# Altium schematic sheet Connector-Sheet.SchDoc
size A4; DocumentNumber: 5; SheetNumber: 5; SheetTotal: 5
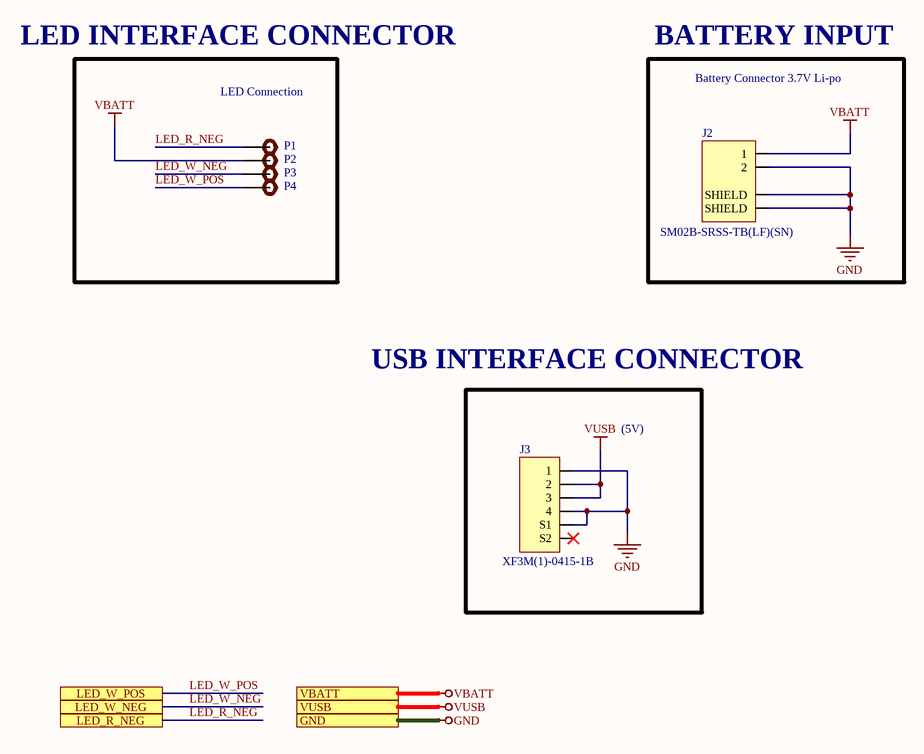
[diagram p0: Connector-Sheet.SchDoc]

## Parts
J2  SM02B-SRSS-TB(LF)(SN)  [SM02B-SRSS-TB(LF)(SN)]
J3  XF3M(1)-0415-1B  [XF3M(1)-0415-1B]
P1  TEST POINT 0.5mm Dia  [Test-point - 0.5mm]  (value not drawn)  (no BOM)
P2  TEST POINT 0.5mm Dia  [Test-point - 0.5mm]  (value not drawn)  (no BOM)
P3  TEST POINT 0.5mm Dia  [Test-point - 0.5mm]  (value not drawn)  (no BOM)
P4  TEST POINT 0.5mm Dia  [Test-point - 0.5mm]  (value not drawn)  (no BOM)

## Blocks framed on the sheet
LED Connection: P1-P4
BATTERY INPUT: J2
(5V): J3

## Ports
GND (see Top-Sheet[1B], Controller-Sheet[2D], LED-Driver-Sheet[2D], Power-Sheet[4C]), LED_R_NEG (see Top-Sheet[2B], LED-Driver-Sheet[1D]), LED_W_NEG (see Top-Sheet[2B], LED-Driver-Sheet[1D]), LED_W_POS (see Top-Sheet[2B], LED-Driver-Sheet[1D]), VBATT (see Top-Sheet[1A], Controller-Sheet[2D], LED-Driver-Sheet[2D], Power-Sheet[4C]), VUSB (see Top-Sheet[1A], Power-Sheet[4C])

## Nets
GND: J2.2 J2.3(SHIELD) J2.4(SHIELD) J3.1 J3.4 J3.S1 ; port GND
VBATT: J2.1 P2.1 ; port VBATT
VUSB: J3.2 J3.3 ; port VUSB
LED_R_NEG: P1.1 ; port LED_R_NEG
LED_W_NEG: P3.1 ; port LED_W_NEG
LED_W_POS: P4.1 ; port LED_W_POS

Not connected (* = marked no-connect by the designer): J3 S2*

## Notes on the sheet
- LED INTERFACE CONNECTOR
- Battery Connector 3.7V Li-po
- USB INTERFACE CONNECTOR
- File:
- Title:
- Date:
- Page
- Num:
- Total:
- Drawn By: Huzaifa Ali

## Library data of the parts
J2 = SM02B-SRSS-TB(LF)(SN): Connector Header Surface Mount, Right Angle 2 position 0.039 _1.00mm_; Manufacturer Part NUmber: SM02B-SRSS-TB_LF__SN_; Manufacturer: JST Sales; SnapEDA_Link: https://www.snapeda.com/parts/SM02B-SRSS-TB%28LF%29%28SN%29/JST%20Sales%20America%20Inc./view-part/447499/?ref=snap; Price: None; Value: *; Availability: Unavailable; Package: None; Digikey Part Number: 455-SM02B-SRSS-TBDKR-ND; ComponentLink1Description: Digikey Link; ComponentLink1URL: https://www.digikey.com/en/products/detail/jst-sales-america-inc/SM02B-SRSS-TB/926708?s=N4IgTCBcDaIMoFkAMYBCBaOAlOd0BVUQBdAXyA
J3 = XF3M(1)-0415-1B: 4 Position FFC, FPC Connector Contacts, Top and Bottom 0.039" (1.00mm) Surface Mount, Right Angle; Manufacturer: Omron Electronics Inc-EMC Div; Item Type: FPC-1mm; Manufacturer Part Number: XF3M(1)-0415-1B; Digikey Part Number: OR1210CT-ND; ComponentLink1Description: Digikey Link; ComponentLink1URL: https://www.digikey.com/en/products/detail/omron-electronics-inc-emc-div/XF3M-1-0415-1B/4695932; Package: 1mm FPC
P1-P4 = TEST POINT 0.5mm Dia: Test Point ON; Item Type: Test Point; Manufacturer Part Number: TEST POINT 0.5mm Dia